# EAGLE design tranc_3cV2 (EAGLE 9.6.2)
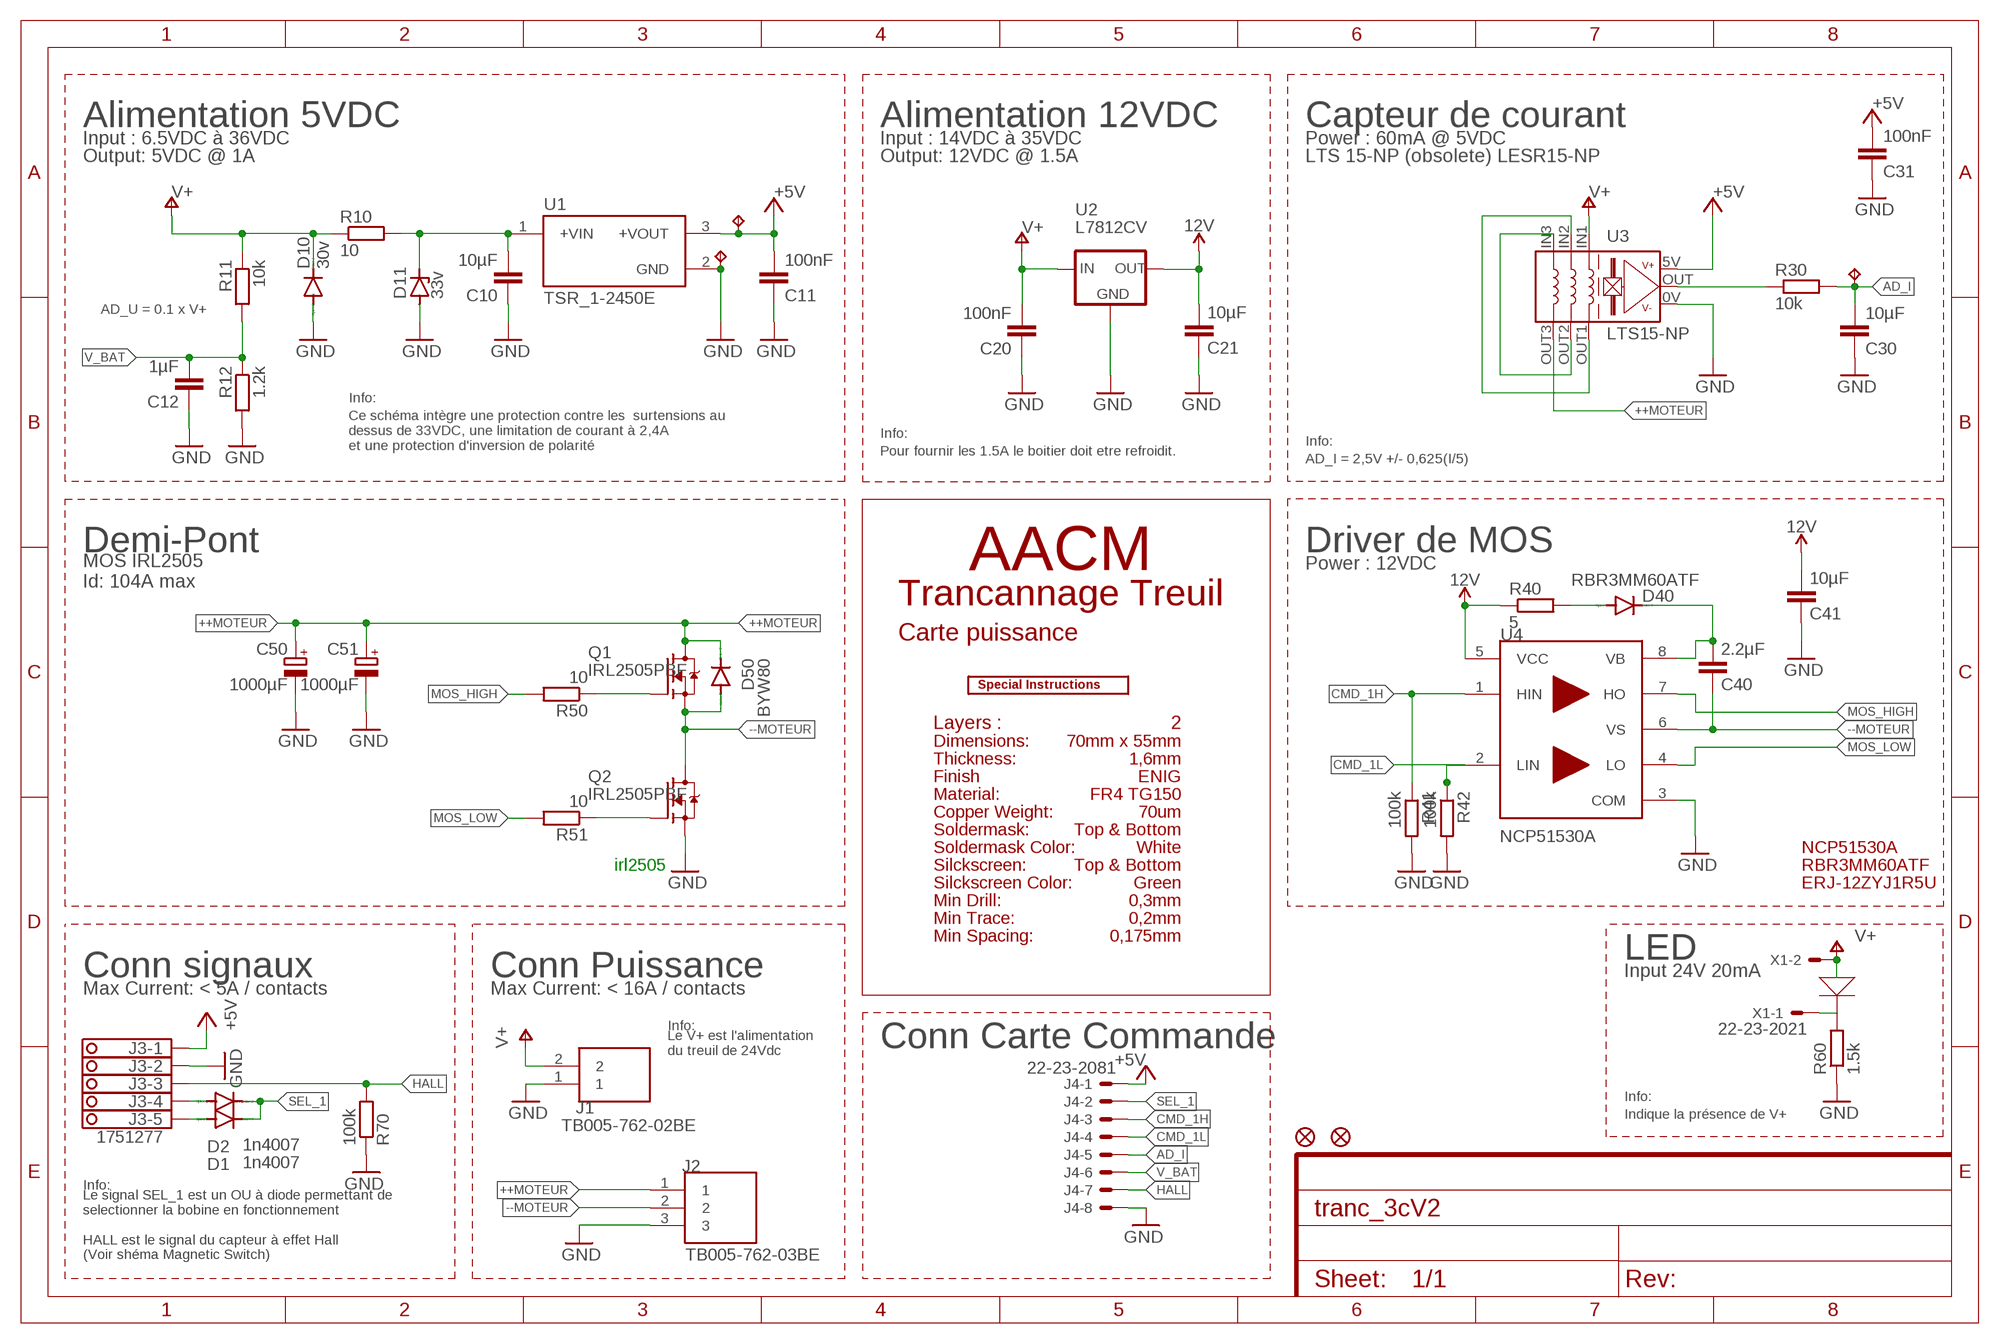
[diagram p0: schematic, sheet 1]

## Parts
5V  TPB1,27  [B1,27]
AD_I  TPB1,27  [B1,27]
C10  10µF  C-EUC1210  [C1210]
C11  100nF  C-EUC0603  [C0603]
C12  1µF  C-EUC0805  [C0805]
C20  100nF  C-EUC0603  [C0603]
C21  10µF  C-EUC1210  [C1210]
C30  10µF  C-EUC1210  [C1210]
C31  100nF  C-EUC0603  [C0603]
C40  2.2µF  C-EUC1206  [C1206]
C41  10µF  C-EUC1210  [C1210]
C50  1000µF  CPOL-EUE7.5-18  [E7,5-18]
C51  1000µF  CPOL-EUE7.5-18  [E7,5-18]
D1  1n4007  DIODE-SOD80C  [SOD80C]
D2  1n4007  DIODE-SOD80C  [SOD80C]
D10  30v  DIODE-DO214AA  [DO214AA]
D11  33v  ZENER-DIODESMB  [SMB]
D40  RBR3MM60ATF  DIODE-SOD123  [SOD123]
D50  BYW80  [TO220ACS]
FD1  FIDUCIAL1X2  [FIDUCIAL-1X2]
FD2  FIDUCIAL1X2  [FIDUCIAL-1X2]
GND  TPB1,27  [B1,27]
J1  TB005-762-02BE  [CUI_TB005-762-02BE]
J2  TB005-762-03BE  [CUI_TB005-762-03BE]
J3  1751277  [1751277]
J4  22-23-2081  [22-23-2081]
Q1  IRL2505PBF  [TO220UPDOWN]
Q2  IRL2505PBF  [TO220UPDOWN]
R10  10  R-EU_R2512  [R2512]
R11  10k  R-EU_R0603  [R0603]
R12  1.2k  R-EU_R0603  [R0603]
R30  10k  R-EU_R0603  [R0603]
R40  5  R-EU_R2010  [R2010]
R41  100k  R-EU_R0805  [R0805]
R42  100k  R-EU_R0805  [R0805]
R50  10  R-EU_R0805  [R0805]
R51  10  R-EU_R0805  [R0805]
R60  1.5k  R-EU_R0603  [R0603]
R70  100k  R-EU_R0603  [R0603]
U1  TSR_1-2450E  [CONV_TSR_1-2450E]
U2  L7812CV  78XXS  [78XXS]
U3  LTS15-NP  [LTS15-NP]
U4  NCP51530A  IRS2181SOIC  [SOIC127P610X420-8N]
U$1  SPECIAL_INSTRUCTIONS-PRODUCTION  [PRODUCTION_INSTRUCTIONS]
X1  22-23-2021  [22-23-2021]

## Nets
12V: C21.1 C41.1 R40.1 U2.OUT U4.5(VCC)
+5V: 5V.TP C11.2 C31.2 J3.1 J4.1 U1.3(+VOUT) U3.5V(V+)
++MOTEUR [Power]: C50.+ C51.+ D50.C J2.1 Q1.2(D) U3.OUT3
--MOTEUR [Power]: C40.2 D50.A J2.2 Q1.3(S) Q2.2(D) U4.6(VS)
AD_I: AD_I.TP C30.2 J4.5 R30.2
BOOTSTRAP: D40.A R40.2
CMD_1H: J4.3 R41.1 U4.1(HIN)
CMD_1L: J4.4 R42.1 U4.2(LIN)
GND: C10.1 C11.1 C12.1 C20.1 C21.2 C30.1 C31.1 C41.2 C50.- C51.- D10.A D11.A GND.TP J1.1 J2.3 J3.2 J4.8 Q2.3(S) R12.2 R41.2 R42.2 R60.1 R70.1 U1.2(GND) U2.GND U3.0V U4.3(COM)
HALL: J3.3 J4.7 R70.2
LED_K: R60.2 X1.1
MOS_HIGH: R50.2 U4.7(HO)
MOS_HIGH_GATE: Q1.1(G) R50.1
MOS_LOW: R51.2 U4.4(LO)
MOS_LOW_GATE: Q2.1(G) R51.1
SEL_1: D1.C D2.C J4.2
SENSOR_OUT: R30.1 U3.OUT(VOUT)
SPIRE1 [Power]: U3.IN2 U3.OUT1
SPIRE2 [Power]: U3.IN3 U3.OUT2
TSR_IN: C10.2 D11.C R10.2 U1.1(+VIN)
V+ [Power]: C20.2 D10.C J1.2 R10.1 R11.1 U2.IN U3.IN1 X1.2
V_BAT: C12.2 J4.6 R11.2 R12.1
VB: C40.1 D40.C U4.8(VB)
X3-1: D1.A J3.5
X3-2: D2.A J3.4

## Notes on the sheet
- Alimentation 5VDC | Alimentation 12VDC | Capteur de courant
- Input : 6.5VDC à 36VDC | Input : 14VDC à 35VDC | Power : 60mA @ 5VDC
- Output: 5VDC @ 1A | Output: 12VDC @ 1.5A | LTS 15-NP (obsolete) LESR15-NP
- AD_U = 0.1 x V+
- Info:
- Ce schéma intègre une protection contre les  surtensions au 
  dessus de 33VDC, une limitation de courant à 2,4A
  et une protection d'inversion de polarité
- Info:
- Pour fournir les 1.5A le boitier doit etre refroidit. | Info:
- AD_I = 2,5V +/- 0,625(I/5)
- Demi-Pont | Driver de MOS
- AACM | Power : 12VDC
- MOS IRL2505
  Id: 104A max
- Trancannage Treuil
- Carte puissance
- Layers : | 2
- Dimensions: | 70mm x 55mm
- Thickness: | 1,6mm
- Finish | ENIG
- Material: | FR4 TG150
- Copper Weight: | 70um
- Soldermask: | Top & Bottom
- Soldermask Color: | White | NCP51530A
- irl2505 | Silckscreen: | Top & Bottom | RBR3MM60ATF
- Silckscreen Color: | Green | ERJ-12ZYJ1R5U
- Min Drill: | 0,3mm
- Min Trace: | 0,2mm
- Min Spacing: | 0,175mm
- LED
- Conn signaux | Conn Puissance | Input 24V 20mA
- Max Current: < 5A / contacts | Max Current: < 16A / contacts
- Info:
- Le V+ est l'alimentation 
  du treuil de 24Vdc
- Conn Carte Commande
- Info:
- Indique la présence de V+
- Le signal SEL_1 est un OU à diode permettant de 
  selectionner la bobine en fonctionnement
  
  HALL est le signal du capteur à effet Hall 
  (Voir shéma Magnetic Switch)
- Info:

## Library data of the parts
5V AD_I GND = testpad:TP: Test pad
C10-C12 C20 C21 C30 C31 C40 C41 = rcl:C-EU: CAPACITOR, European symbol; SPICEPREFIX: C
C50 C51 = rcl:CPOL-EU: POLARIZED CAPACITOR, European symbol; SPICEPREFIX: C
D1 D2 D10 D40 = diode:DIODE-: DIODE
D11 = diode:ZENER-DIODE: Z-Diode
D50 = diode:BYW80: DIODE high-efficiency fast recovery rectifier (ST)
FD1 FD2 = SparkFun-Aesthetics:FIDUCIAL: Fiducial Alignment Points Point-of-reference for pick-and-place machines and other optical instruments.
J1 = TB005-762-02BE:TB005-762-02BE; CUI_PURCHASE_URL: https://www.cuidevices.com/product/interconnect/connectors/terminal-blocks/tb005-762-series?utm_source=snapeda.com&utm_medium=referral&utm_campaign=snapedaBOM; DESCRIPTION: 2~24 Poles, Screw Type, Horizontal, 7.62 Pitch, 26~10 (AWG), Terminal Block Connector; DIGI-KEY_PART_NUMBER: 102-6189-ND; MF: CUI Devices; MP: TB005-762-02BE; PACKAGE: None; PURCHASE-URL: https://pricing.snapeda.com/search/part/TB005-762-02BE/?ref=eda
J2 = TB005-762-03BE:TB005-762-03BE; CUI_PURCHASE_URL: https://www.cuidevices.com/product/interconnect/connectors/terminal-blocks/tb005-762-series?utm_source=snapeda.com&utm_medium=referral&utm_campaign=snapedaBOM; DESCRIPTION: 2~24 Poles, Screw Type, Horizontal, 7.62 Pitch, 26~10 (AWG), Terminal Block Connector; DIGI-KEY_PART_NUMBER: 102-6190-ND; MF: CUI Devices; MP: TB005-762-03BE; PACKAGE: None; PURCHASE-URL: https://pricing.snapeda.com/search/part/TB005-762-03BE/?ref=eda
J3 = con-phoenix-350:1751277: MKDS 1/ 5-3,5 Printklemme Nennstrom: 10 A Bemessungsspannung: 160 V Raster: 3,5 mm Polzahl: 5 Montageart: Löten Anschlussart: Schraubanschluss Anschlussrichtung vom Leiter zur Platine: 0° Source: http://eshop.phoenixcontact.com .. 1751277.pdf; OC_FARNELL: unknown; OC_NEWARK: unknown
J4 = con-molex:22-23-2081: .100" (2.54mm) Center Header - 8 Pin; MF: MOLEX; MPN: 22-23-2081; OC_FARNELL: 1756826; OC_NEWARK: 01C7592
Q1 Q2 = transistor-fet:IRL2505PBF
R10-R12 R30 R40-R42 R50 R51 R60 R70 = rcl:R-EU_: RESISTOR, European symbol; SPICEPREFIX: R
U1 = TSR_1-2450E:TSR_1-2450E: Check prices <https://pricing.snapeda.com/parts/TSR%201-2450E/Traco%20Power/view-part?ref=eda>; AVAILABILITY: In Stock; DESCRIPTION: 1 Amp POL converter, industrial, 6-36 VDC input, pos.-pos. circuit, cost efficient, LM78 compatible, SIP-3; MF: Traco Power; MP: TSR 1-2450E; PACKAGE: SIP-3 Traco Power; PRICE: None; PURCHASE-URL: https://pricing.snapeda.com/search/part/TSR 1-2450E/?ref=eda
U2 = v-reg:78XXS: VOLTAGE REGULATOR
U3 = LEM:LTS15-NP
U4 = IRS2181:IRS2181: IRS2181 DIP762W46P254L988H533Q8B High and Low Side Driver
U$1 = SparkFun-Aesthetics:SPECIAL_INSTRUCTIONS: Special Ordering/Production Instructions Alert Symbol for special PCB ordering instructions or unique production process warnings. Ordering Instructions Production Instructions Types of information that should be added to box: Copper weight Soldermask color Silk color PCB thickness Number of layers PCB Standard: 1.6mm FR4 1 oz copper immersion silver plating red soldermask white silkscreen Types of information that should be added to box: Special wash requirements Depaneling instructions Humidification Glue curing Default text settings: 0.07 inch 9% ratio 50% line distance
X1 = con-molex:22-23-2021: .100" (2.54mm) Center Header - 2 Pin; MF: MOLEX; MPN: 22-23-2021; OC_FARNELL: 1462926; OC_NEWARK: 25C3832

## Net classes
1 Power: width 0.3 mm, clearance 0.5 mm to class 0, clearance 0.5 mm

## Board
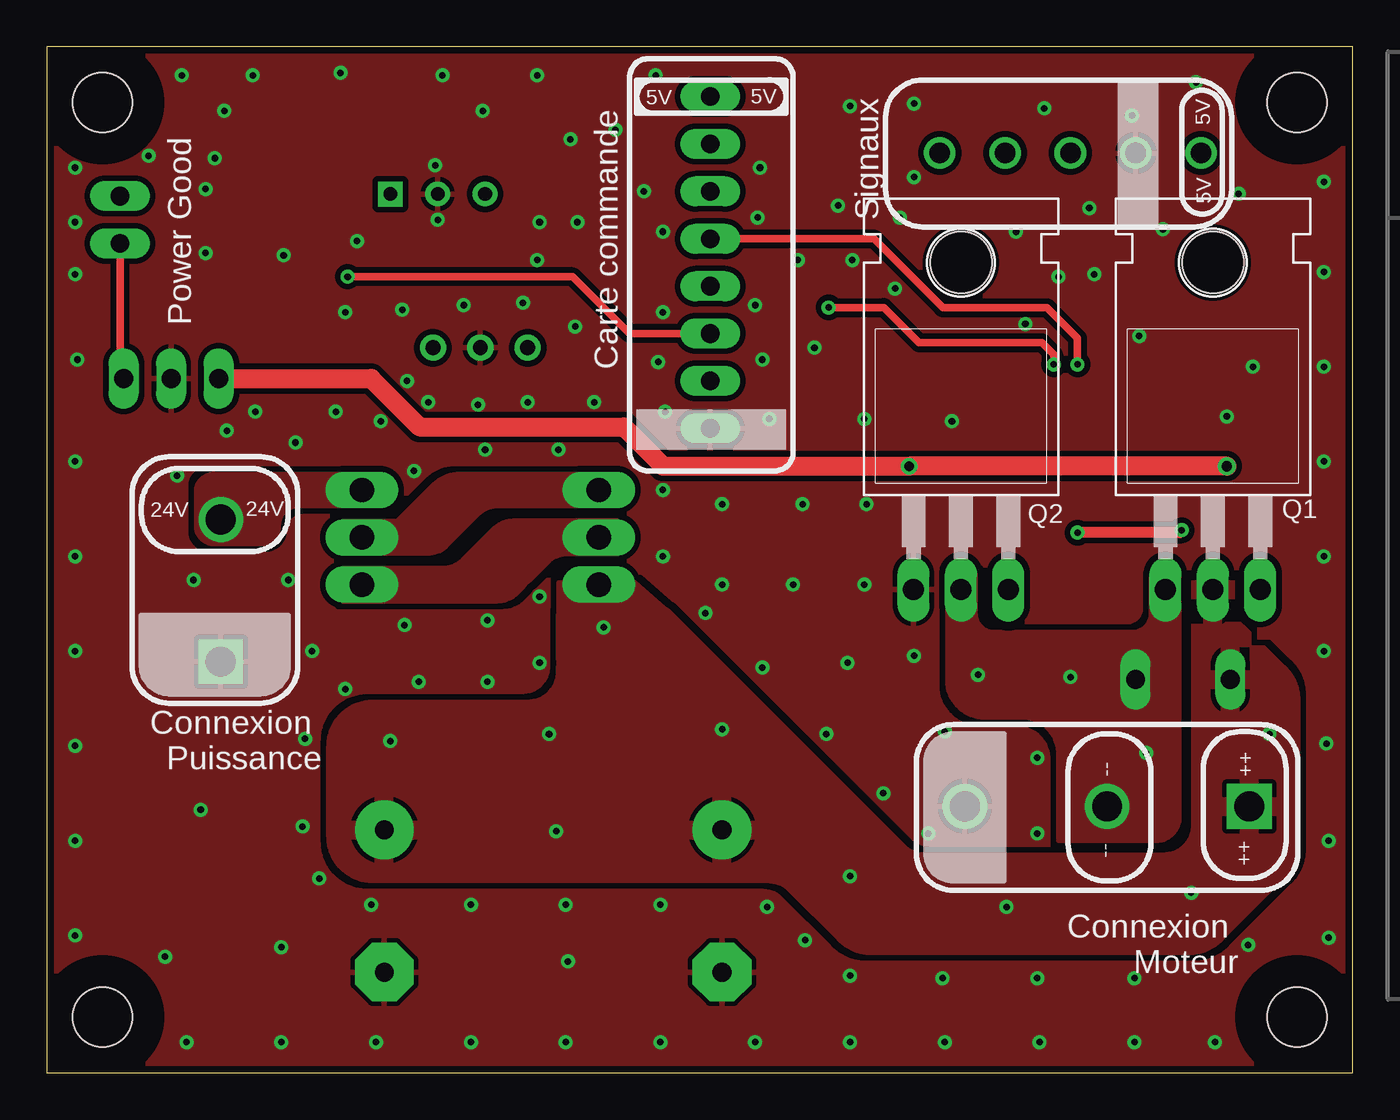
[diagram p1: board, top side]
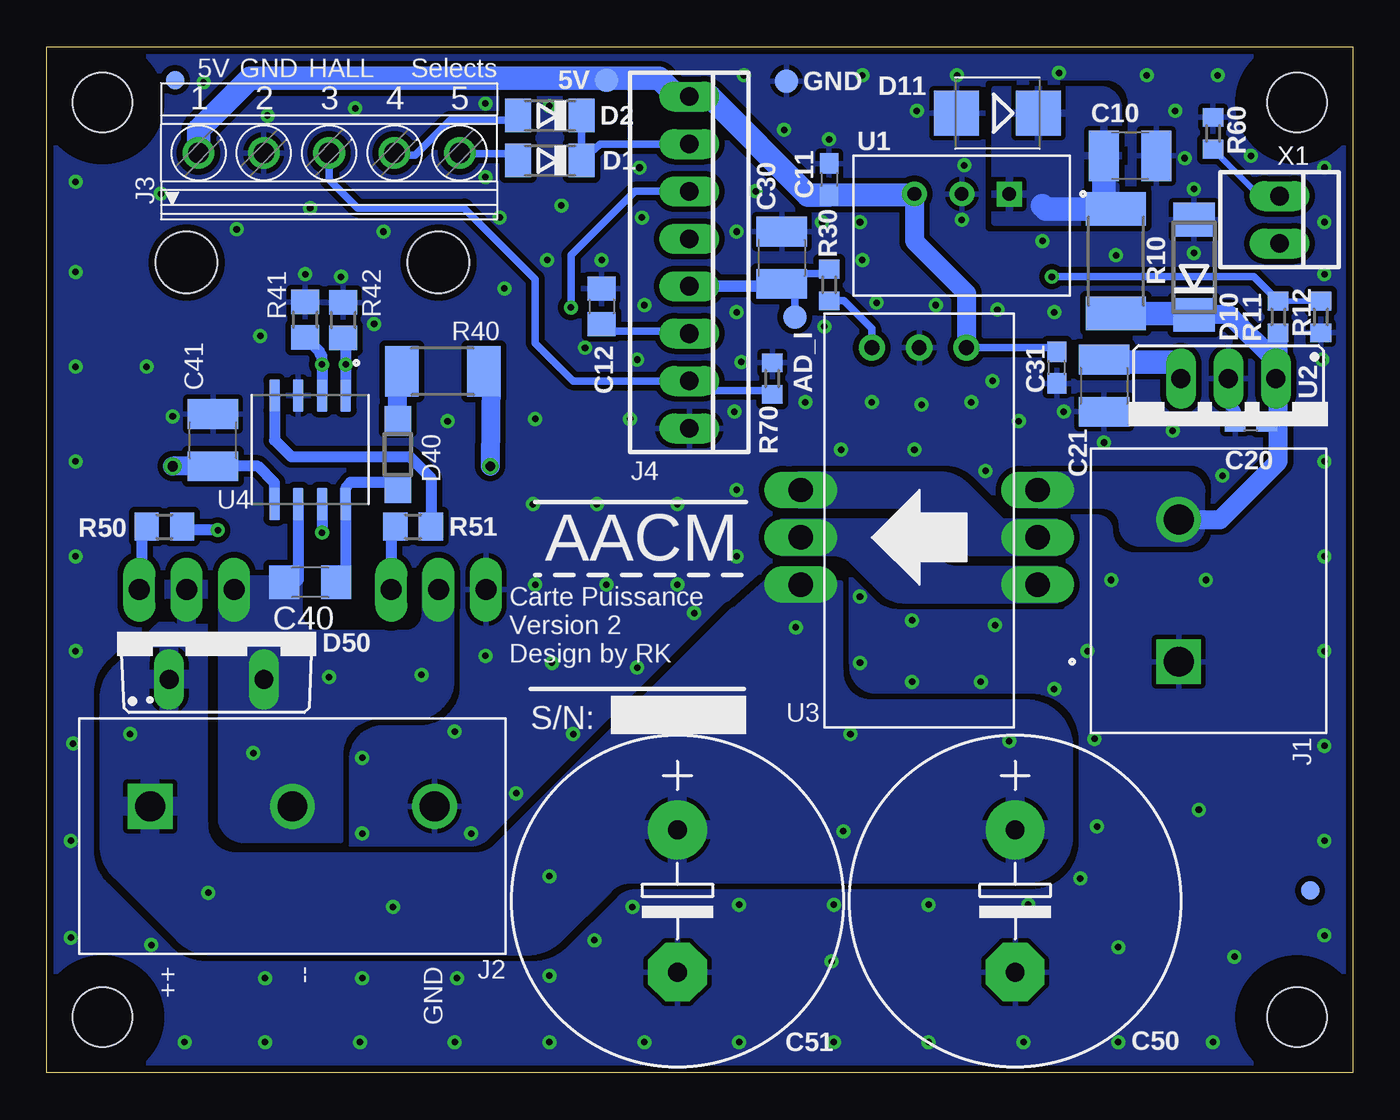
[diagram p2: board, bottom side, seen from below]

Size 70 x 55 mm. Coordinates in mm from the lower left corner, seen from the top.
Outline: 0,0 70,0 70,55 0,55 0,0
Copper layers (1*16): Top 0.035559375mm / dielectric 1.6mm / Bottom 0.035559375mm
Design rules "oshpark-2layer *": minimum track width 8mil, minimum drill 0.3mm, track to track 8mil, track to pad 0.2mm, pad to pad 0.5mm, via to via 6mil, smd to smd 6mil, copper to edge 15mil, drill to drill 0.5mm, minimum pad ring 0.3mm, minimum via ring 0.2mm, stop-mask expansion 2.5mil, vias tented up to drill 0.4mm, thermal gap 10mil
Holes 3.2 mm at 67,3 3,3 3,52 67,52
tRestrict: area 0,49 to 6,55; area 64,49 to 70,55; area 64,0 to 70,6; area 0,0 to 6,6
bRestrict: area 0,0 to 6,6; area 64,0 to 70,6; area 64,49 to 70,55; area 0,49 to 6,55

### Footprints (pad centres in the part's own frame; a part is rotated, then mirrored left to right if it is on the bottom)
B1,27 = smd 1.27 x 1.27: TP 0,0
C1210 = smd 1.6 x 2.7: 1 -1.4,0; 2 1.4,0
C0603 = smd 1.1 x 1: 1 -0.85,0; 2 0.85,0
C0805 = smd 1.3 x 1.5: 1 -0.95,0; 2 0.95,0
C1206 = smd 1.6 x 1.8: 1 -1.4,0; 2 1.4,0
E7,5-18 = drill 1.016 pad 3.15: + -3.81,0 | drill 1.016 pad 3.15 octagon: - 3.81,0
SOD80C = smd 1.4 x 1.8: A 1.7,0; C -1.7,0
DO214AA = smd 1.8 x 2.2: A 2.55,0; C -2.55,0
SMB = smd 2.4 x 2.4: A 2.2,0; C -2.2,0
SOD123 = smd 1.4 x 1.4: A 1.9,0; C -1.9,0
TO220ACS = drill 1.016 long: A 2.54,-2.54; C -2.54,-2.54
FIDUCIAL-1X2 = smd 1 x 1: 1 0,0
CUI_TB005-762-02BE = drill 1.6 square: 1 0,0 | drill 1.6: 2 7.62,0
CUI_TB005-762-03BE = drill 1.6 square: 1 0,0 | drill 1.6: 2 7.62,0; 3 15.24,0
1751277 = drill 1.1 pad 1.7: 1 -7,-0.1; 2 -3.5,-0.1; 3 0,-0.1; 4 3.5,-0.1; 5 7,-0.1
22-23-2081 = drill 1 long: 1 -8.89,0; 2 -6.35,0; 3 -3.81,0; 4 -1.27,0; 5 1.27,0; 6 3.81,0; 7 6.35,0; 8 8.89,0
TO220UPDOWN = drill 1.118 long: 1 2.54,-6.35; 2 0,-6.35; 3 -2.54,-6.35 | hole 3.302: 0,11.176
R2512 = smd 1.8 x 3.2: 1 -2.8,0; 2 2.8,0
R0603 = smd 1 x 1.1: 1 -0.85,0; 2 0.85,0
R2010 = smd 1.8 x 2.7: 1 -2.2,0; 2 2.2,0
R0805 = smd 1.3 x 1.5: 1 -0.95,0; 2 0.95,0
CONV_TSR_1-2450E = drill 0.73 pad 1.13 square: 1 -2.54,-1.7 | drill 0.73 pad 1.13: 2 0,-1.7; 3 2.54,-1.7
78XXS = drill 1.016 long: GND 0,-2.54; IN -2.54,-2.54; OUT 2.54,-2.54
LTS15-NP = drill 0.8: 0V -7.62,6.35; 5V -7.62,8.89; OUT -7.62,3.81 | drill 1.3 long: IN1 0,12.7; IN2 2.54,12.7; IN3 5.08,12.7; OUT1 0,0; OUT2 2.54,0; OUT3 5.08,0
SOIC127P610X420-8N = smd 1.75 x 0.57: 1 -2.905,1.905; 2 -2.905,0.635; 3 -2.905,-0.635; 4 -2.905,-1.905; 5 2.905,-1.905; 6 2.905,-0.635; 7 2.905,0.635; 8 2.905,1.905
22-23-2021 = drill 1 long: 1 -1.27,0; 2 1.27,0

### Placement (x,y rotation side)
5V  40.01,53.21 180 bottom
AD_I  29.91,40.51 180 bottom
C10  11.94,49.15 180 bottom
C11  28.07,47.88 270 bottom
C12  40.26,41.08 270 bottom
C20  5.46,34.86 0 bottom
C21  13.34,36.83 270 bottom
C30  30.61,43.69 270 bottom
C31  15.86,37.8 90 bottom
C40  55.88,26.29 180 bottom
C41  61.09,33.91 90 bottom
C50  18.1,9.21 270 bottom
C51  36.2,9.21 270 bottom
D1  43.03,48.9 180 bottom
D2  43.03,51.31 180 bottom
D10  8.51,43.18 90 bottom
D11  19.05,51.44 180 bottom
D40  51.18,33.15 90 bottom
D50  60.9,23.62 0 bottom
FD1  2.29,9.78 0 bottom
FD2  63.12,53.21 0 bottom
GND  30.35,53.15 180 bottom
J1  9.33,22.03 90 bottom
J2  64.45,14.29 0 bottom
J3  54.86,49.4 0 bottom
J4  35.56,43.43 270 bottom
Q1  62.5,32.25 0 top
Q2  49,32.25 0 top
R10  12.7,43.5 90 bottom
R11  4,40.51 90 bottom
R12  1.72,40.51 270 bottom
R30  28.07,42.23 90 bottom
R40  48.77,37.59 180 bottom
R41  54.1,40.34 90 bottom
R42  56.13,40.37 90 bottom
R50  63.69,29.27 0 bottom
R51  50.36,29.27 0 bottom
R60  7.49,50.36 270 bottom
R70  31.11,37.21 270 bottom
U1  20.95,45.4 180 bottom
U2  6.67,34.67 180 bottom
U3  29.59,31.24 270 bottom
U4  55.88,33.4 270 bottom
U$1  71.88,54.74 0 top
X1  3.94,45.72 270 bottom

### Tracks (layer width: path | path; a pad name or v marks a point on that pad's centre or on a via)
12V  (via drill 0.5, 0.55)
  Top 1.016: U2.OUT 17.4,37.21 19.99,34.62 30.93,34.62 33.04,32.51 v46.23,32.51 v63.25,32.51
  Bottom 0.58: U4.5 57.78,31.62 58.67,32.51 C41.1
  Bottom 1.016: C41.1 v63.25,32.51 | R40.1 46.19,37.21 46.23,32.6 v46.23,32.51
  Bottom 1.27: C21.1 13.34,38.1 9.21,38.1 U2.OUT
+5V
  Bottom 0.406: 5V.TP 40.01,53.3 | U3.5V 16.07,38.86 C31.2
  Bottom 1.016: 23.52,47.08 U1.3 23.5,44.58 20.7,41.78 U3.5V
  Bottom 1.27: 23.52,47.08 C11.2 29.21,47.03 34.45,52.32 J4.1 36.2,52.32 37.17,53.3 40.01,53.3 59.09,53.3 61.85,50.55 61.85,49.32 J3.1
++MOTEUR  (via drill 0.35)
  other vias: 29.84,23.88 18.41,17.78 26.92,18.16 27.3,12.95 36.2,18.41 43.05,10.54 51.44,8.89 61.34,9.65 65.53,18.16
  pour Bottom (isolate 0.305): 61.85,26.67 63.25,26.67 63.25,24.26 66.09,21.41 arc-45 66.67,20 66.67,12.26 arc-45 66.09,10.84 62.64,7.39 arc-45 61.23,6.81 44.18,6.81 arc-45 42.77,7.39 40.08,10.08 arc45 38.67,10.67 17.49,10.67 arc-90 15.49,12.67 15.49,17.5 arc-90 17.49,19.5 25.8,19.5 arc90 27.8,21.5 27.8,24.51 33.02,24.51 45.64,11.89 arc45 47.06,11.3 59.85,11.3 arc90 61.85,13.3
  pour Top (isolate 0.305): 61.85,26.67 63.25,26.67 63.25,24.26 66.09,21.41 arc-45 66.67,20 66.67,12.26 arc-45 66.09,10.84 62.64,7.39 arc-45 61.23,6.81 44.18,6.81 arc-45 42.77,7.39 40.08,10.08 arc45 38.67,10.67 17.49,10.67 arc-90 15.49,12.67 15.49,17.5 arc-90 17.49,19.5 27.8,19.5 27.8,24.51 33.02,24.51 45.64,11.89 arc45 47.06,11.3 59.85,11.3 arc90 61.85,13.3
  pour Top (isolate 0.305, no thermals): 27.43,26.29 27.43,24.51 33.54,24.51 31.53,26.29
  pour Bottom (isolate 0.305, no thermals): 27.43,26.29 27.43,24.38 33.66,24.38 31.5,26.29
  pour Top (isolate 0.305): 61.85,26.67 63.25,26.67 63.25,24.26 66.09,21.41 arc-45 66.67,20 66.67,12.26 arc-45 66.09,10.84 62.64,7.39 arc-45 61.23,6.81 44.18,6.81 arc-45 42.77,7.39 40.08,10.08 arc45 38.67,10.67 17.49,10.67 arc-90 15.49,12.67 15.49,17.5 arc-90 17.49,19.5 25.8,19.5 arc90 27.8,21.5 27.8,24.51 33.02,24.51 45.64,11.89 arc45 47.06,11.3 59.85,11.3 arc90 61.85,13.3
  pour Top (isolate 0.305): 61.85,26.67 63.25,26.67 63.25,24.26 66.09,21.41 arc-45 66.67,20 66.67,12.26 arc-45 66.09,10.84 62.64,7.39 arc-45 61.23,6.81 44.18,6.81 arc-45 42.77,7.39 40.08,10.08 arc45 38.67,10.67 17.49,10.67 arc-90 15.49,12.67 15.49,17.5 arc-90 17.49,19.5 25.8,19.5 arc90 27.8,21.5 27.8,24.51 33.02,24.51 45.64,11.89 arc45 47.06,11.3 59.85,11.3 arc90 61.85,13.3
--MOTEUR  (via drill 0.35)
  Bottom 0.58: U4.6 56.52,26.42 56.65,26.29
  other vias: 54.86,21.21 49.91,21.34 58.93,17.14
  pour Bottom (isolate 0.305, rank 2, no thermals): 48.26,26.8 49.78,26.8 49.78,24.62 arc90 50.78,23.62 55.39,23.62 arc90 56.39,24.62 56.39,26.54 60.71,26.54 60.71,12.45 54.23,12.45 54.23,17.05 arc90 52.23,19.05 50.26,19.05 arc-90 48.26,21.05
  pour Top (isolate 0.305, rank 2, no thermals): 48.26,26.8 49.78,26.8 49.78,24.62 arc90 50.78,23.62 58.18,23.62 arc90 59.18,24.62 59.18,26.54 60.71,26.54 60.71,12.45 54.23,12.45 54.23,17.05 arc90 52.23,19.05 50.26,19.05 arc-90 48.26,21.05
AD_I
  Bottom 0.406: R30.2 28.32,42.82 29.69,42.82 30.23,42.29 C30.2 | AD_I.TP 29.91,42.1 30.1,42.29 C30.2 | C30.2 30.73,42.16 31.24,42.16
  Bottom 0.61: 31.24,42.16 J4.5
BOOTSTRAP
  Bottom 1.016: D40.A 51.18,37.38 R40.2
CMD_1H  (via drill 0.35)
  Top 0.406: v41.91,41.02 44.86,41.02 46.76,39.13 53.34,39.13 53.98,38.49 v53.98,37.97
  Bottom 0.406: J4.3 38.48,47.24 41.91,43.81 v41.91,41.02
  Bottom 0.58: U4.1 v53.98,37.97 53.98,39.27 R41.1
CMD_1L  (via drill 0.35)
  Top 0.406: J4.4 44.33,44.7 48.02,41.01 53.61,41.01 55.24,39.37 v55.24,37.97
  Bottom 0.58: U4.2 v55.24,37.97 55.24,38.44 55.34,38.54 55.34,38.63 R42.1
GND  (via drill 0.35)
  Bottom 0.406: C10.1 10.54,48.13
  Bottom 0.58: U2.GND 6.67,35.88 6.31,35.52 C20.1
  other vias: 8.51,47.37 9.02,49.02 20.95,45.72 23.37,51.56 21.21,53.47 15.49,35.43 9.65,34.42 11.18,35.43 13.34,33.78 20.83,48.64 7.24,53.47 1.52,48.51 68.45,47.75 62.61,1.65 1.52,7.37 7.49,1.65 6.35,6.22 1.65,38.23 1.52,12.45 1.52,17.53 1.52,22.61 1.52,27.69 1.52,32.77 12.57,1.65 17.65,1.65 22.73,1.65 27.81,1.65 32.89,1.65 37.97,1.65 43.05,1.65 48.13,1.65 53.21,1.65 58.29,1.65 68.45,22.61 68.45,27.69 68.45,32.77 68.45,37.85 68.45,42.93 11.05,53.47 26.29,53.47 22.73,9.02 27.81,9.02 32.89,9.02 12.57,6.73 14.61,10.41 23.62,24.26 14.22,22.61 12.95,26.42 7.87,26.42 6.99,32 17.91,34.92 23.5,33.4 33.02,31.24 36.2,30.48 40.51,30.48 43.94,30.48 43.81,26.16 40.01,26.16 36.2,26.16 33.02,27.69 38.61,8.89 55.88,46.35 58.17,51.31 64.64,37.85 38.73,35.05 43.81,35.05 61.59,53.09 32.64,53.47 38.23,48.51 42.42,46.48 41.15,38.86 40.26,43.56 16.64,44.58 19.94,20.95 53.47,51.69 33.15,35.43 28.32,40.01 20.45,35.94 25.78,35.94 29.34,35.94 30.48,50.55 26.42,45.59 32,47.24 22.35,41.15 28.07,50.04 28.45,45.59 43.18,43.56 46.48,48.01 46.48,51.94 8.51,43.94 19.3,37.08 26.29,43.56 12.7,43.81 9.53,51.56 52.45,40.13 45.47,42.04 16,40.77 23.11,35.81 27.43,33.4 19.68,32.26 1.52,45.59 1.52,42.8 5.46,49.15 15.75,53.59 8.26,14.1 54.23,42.67 56.13,42.8 58.55,39.5 33.02,45.09 38.1,45.85 33.02,40.77 37.97,41.15 32.77,38.1 38.35,38.23 19.18,24 63.25,35.18 48.51,34.92 26.42,25.53 26.42,21.97 23.62,20.95 13.84,17.91 13.72,13.21 16,20.57 17.4,9.02 27.94,5.97 43.05,5.21 48.01,5.08 53.09,5.08 58.29,5.08 40.64,7.11 35.31,24.64 38.35,21.72 41.78,18.16 44.83,14.99 47.24,12.83 53.09,12.83 53.09,16.89 64.39,6.86 68.58,17.65 68.71,12.45 68.71,7.24 46.48,22.35 48.13,18.29 42.93,21.97 51.94,45.09 45.72,45.85 59.82,45.21 63.88,47.12 19.05,40.89 25.53,41.27 43.05,51.82
  pour Bottom (isolate 0.305, rank 6): 0,-0.09 0,55.88 69.85,55.88 69.85,-0.09
  pour Top (isolate 0.305, rank 6): 0,55.75 69.98,55.75 69.98,0 0,0
HALL
  Bottom 0.406: R70.2 31.33,36.58 35.05,36.58 J4.7 41.78,37.08 43.81,39.12 43.81,42.55 47.62,46.35 53.34,46.35 54.86,47.88 J3.3
LED_K
  Bottom 0.3: R60.2 4.98,46.99 X1.1
MOS_HIGH  (via drill 0.35)
  Top 0.58: v60.83,29.08 60.71,28.96 v55.24,28.96
  Bottom 0.58: U4.7 v55.24,28.96 | v60.83,29.08 62.55,29.08 R50.2
MOS_HIGH_GATE
  Bottom 0.58: R50.1 64.64,29.02 64.89,28.77 64.89,26.04 Q1.1
MOS_LOW
  Bottom 0.58: U4.4 57.78,33.91 56.9,33.02 50.55,33.02 49.41,31.88 R51.2
MOS_LOW_GATE
  Bottom 0.58: R51.1 51.54,29.04 Q2.1
SEL_1
  Bottom 0.406: D2.C D1.C 40.35,49.78 J4.2
SENSOR_OUT
  Bottom 0.406: U3.OUT 25.78,39.88 27.28,41.38 R30.1
SPIRE1
  pour Bottom (no thermals): 15.88,29.59 18.76,29.59 20.72,31.55 arc-45 22.13,32.13 29.72,32.13 29.72,30.35 24.21,30.35 arc45 23.15,29.91 21.49,28.25 arc-45 20.43,27.81 15.88,27.81
  pour Top (no thermals): 15.88,29.59 15.88,27.81 20.43,27.81 arc45 21.49,28.25 23.15,29.91 arc-45 24.21,30.35 29.72,30.35 29.72,32.13 22.13,32.13 arc45 20.72,31.55 18.76,29.59
SPIRE2
  pour Bottom (no thermals): 15.88,27.05 21.19,27.05 arc45 22.25,27.49 23.91,29.15 arc-45 24.97,29.59 30.61,29.59 30.61,27.81 27.89,27.81 arc45 26.83,27.37 25.17,25.71 arc-45 24.11,25.27 15.88,25.27
  pour Top (no thermals): 30.61,29.59 30.61,27.81 27.93,27.81 arc45 26.87,27.37 25.2,25.71 arc-45 24.14,25.27 15.88,25.27 15.88,27.05 21.22,27.05 arc45 22.28,27.49 23.94,29.15 arc-45 25.01,29.59
TSR_IN
  Bottom 1.016: C10.2 13.34,46.23
  Bottom 1.27: 13.46,46.23 13.34,46.23 12.77,46.23 R10.2 | R10.2 13.34,46.94 C10.2 | R10.2 16.45,46.3 16.64,46.48
  pour Bottom: 12.57,50.16 12.57,45.59 19.18,45.59 19.18,52.7 13.57,52.7 arc90 12.57,51.7
V+
  Top 0.3: U2.IN 3.94,37.4
  Top 0.406: 3.94,37.4 X1.2
  Bottom 0.58: C20.2 4.55,34.8 4,34.8
  Bottom 1: 6.56,40.57 4.13,38.14 U2.IN 4,37.34 R11.1 | R10.1 11.94,40.7 11.81,40.57
  Bottom 1.016: J1.2 7.11,29.65 4,32.77 4,34.8 4,37.34 | 6.56,40.57 6.62,40.63 D10.C
  Bottom 1.27: 8.58,40.5 8.58,40.56 D10.C 8.58,40.7 R10.1
  pour Bottom (no thermals): 16.89,32.13 16.89,30.35 13.45,30.35 arc90 12.45,29.35 12.45,29.32 arc-90 11.45,28.32 9,28.32 arc-90 8,29.32 8,31.13 arc-90 9,32.13
  pour Top (no thermals): 16.89,32.13 16.89,30.35 13.45,30.35 arc90 12.45,29.35 12.45,29.32 arc-90 11.45,28.32 9,28.32 arc-90 8,29.32 8,31.13 arc-90 9,32.13
V_BAT  (via drill 0.35)
  Top 0.406: v16.13,42.67 28.19,42.67 31.24,39.62 J4.6
  Bottom 0.305: R11.2 R12.1
  Bottom 0.406: C12.2 39.88,39.75 35.69,39.75 J4.6 | R11.2 5.31,42.67 v16.13,42.67
VB
  Bottom 0.406: D40.C 51.58,31.65 51.82,31.65
  Bottom 0.58: C40.1 53.98,26.79 U4.8 53.98,31.34 53.72,31.65 51.82,31.65
X3-1
  Bottom 0.406: J3.5 47.84,49.28 45.11,49.28 D1.A
X3-2
  Bottom 0.406: D2.A 44.98,51.05 48.39,51.05 50.27,49.18 51.24,49.18 J3.4

### Text on the board
tNames: 5V | 5V | 5V | Power Good | 5V | Signaux | Carte commande | 24V | 24V | Connexion / Puissance | -- | ++ | -- | ++ | Connexion / Moteur
bNames: Selects | HALL | GND | 5V | AACM | Carte Puissance | Version 2 | Design by RK | S/N: | GND | -- | ++
tStop: - | - | - | - | - | - | - | -
tDocu: Hall | Selects | SEL_1 | 1H | 1L | AD_I | V_BAT | HALL